# Altium schematic sheet Top.SchDoc
size A4; SheetNumber: 1; SheetTotal: 4
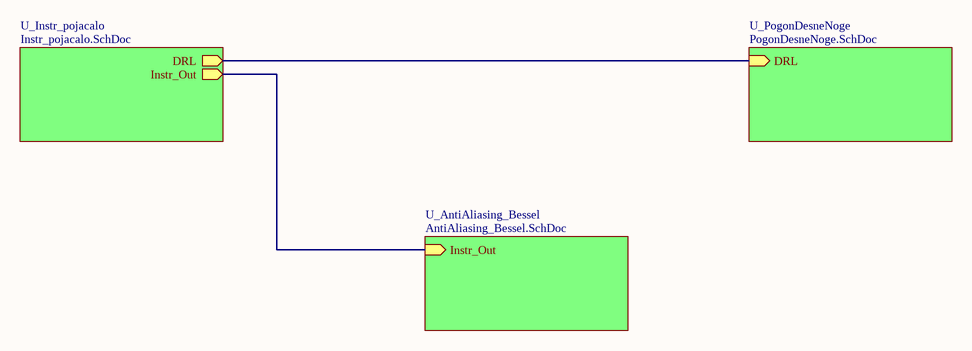
[diagram p0: Top.SchDoc]

## Sub-sheets
U_AntiAliasing_Bessel = AntiAliasing_Bessel.SchDoc: Instr_Out (in)
U_Instr_pojacalo = Instr_pojacalo.SchDoc: DRL (out), Instr_Out (out)
U_PogonDesneNoge = PogonDesneNoge.SchDoc: DRL (in)

## Nets
(unnamed): sheet U_Instr_pojacalo/DRL, sheet U_PogonDesneNoge/DRL
(unnamed): sheet U_Instr_pojacalo/Instr_Out, sheet U_AntiAliasing_Bessel/Instr_Out